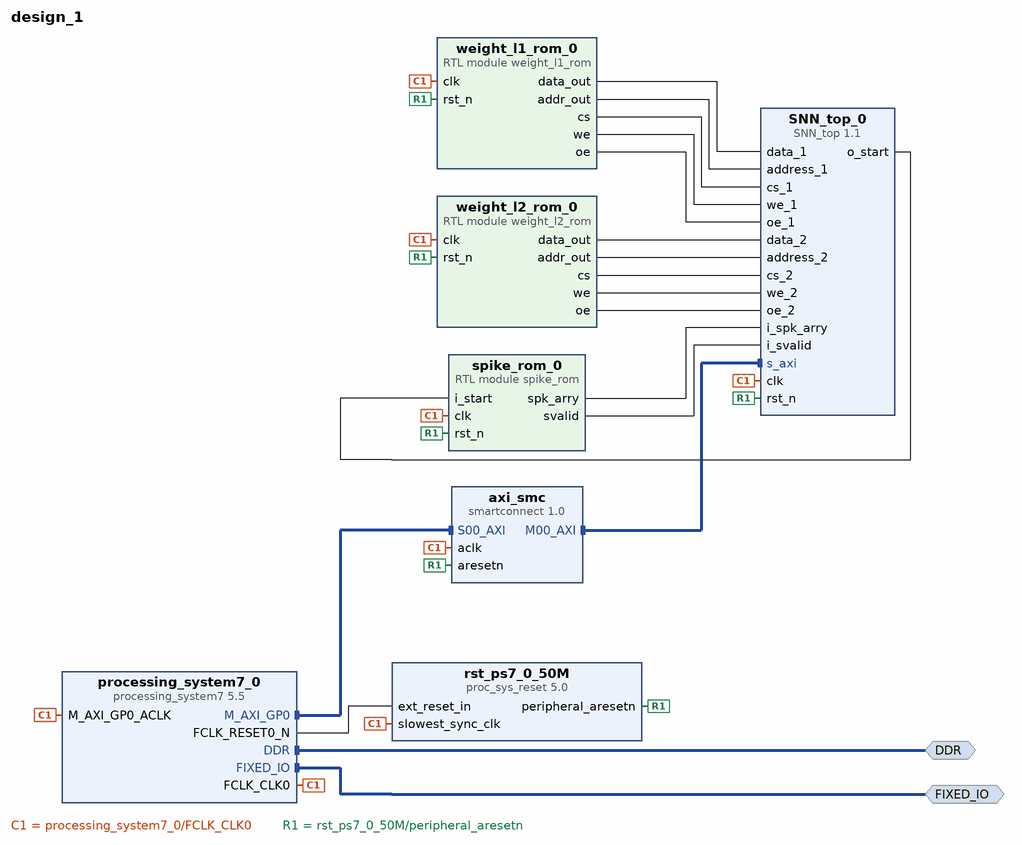
[diagram p0: block diagram of the top level]
# Vivado block design design_1, xc7z020clg484-1, Vivado 2017.1
create_bd_design design_1

create_bd_intf_port -mode Master -vlnv xilinx.com:interface:ddrx_rtl:1.0 DDR
create_bd_intf_port -mode Master -vlnv xilinx.com:display_processing_system7:fixedio_rtl:1.0 FIXED_IO

create_bd_cell -type ip -vlnv xilinx.com:ip:processing_system7:5.5 processing_system7_0
set_property -dict [list \
  CONFIG.PCW_FPGA0_PERIPHERAL_FREQMHZ 50 \
  CONFIG.PCW_UART1_PERIPHERAL_ENABLE 1 \
] [get_bd_cells processing_system7_0]
# 2 more settings of processing_system7_0 are not shown: defaults, MIO pin electricals, DDR timing, and values the tool derives
create_bd_cell -type ip -vlnv xilinx.com:ip:smartconnect:1.0 axi_smc
set_property -dict {CONFIG.NUM_SI 1} [get_bd_cells axi_smc]
create_bd_cell -type ip -vlnv xilinx.com:ip:proc_sys_reset:5.0 rst_ps7_0_50M
create_bd_cell -type module -reference weight_l1_rom weight_l1_rom_0
create_bd_cell -type module -reference weight_l2_rom weight_l2_rom_0
create_bd_cell -type module -reference spike_rom spike_rom_0
create_bd_cell -type ip -vlnv SNN:processor:SNN_top:1.1 SNN_top_0

# ---- connections ----

connect_bd_intf_net [get_bd_intf_pins processing_system7_0/M_AXI_GP0] [get_bd_intf_pins axi_smc/S00_AXI]
connect_bd_intf_net [get_bd_intf_pins axi_smc/M00_AXI] [get_bd_intf_pins SNN_top_0/s_axi]
connect_bd_intf_net [get_bd_intf_ports DDR] [get_bd_intf_pins processing_system7_0/DDR]
connect_bd_intf_net [get_bd_intf_ports FIXED_IO] [get_bd_intf_pins processing_system7_0/FIXED_IO]
connect_bd_net [get_bd_pins processing_system7_0/FCLK_CLK0] \
  [get_bd_pins processing_system7_0/M_AXI_GP0_ACLK] [get_bd_pins axi_smc/aclk] [get_bd_pins rst_ps7_0_50M/slowest_sync_clk] \
  [get_bd_pins weight_l1_rom_0/clk] [get_bd_pins weight_l2_rom_0/clk] [get_bd_pins spike_rom_0/clk] \
  [get_bd_pins SNN_top_0/clk]
connect_bd_net [get_bd_pins processing_system7_0/FCLK_RESET0_N] [get_bd_pins rst_ps7_0_50M/ext_reset_in]
connect_bd_net [get_bd_pins rst_ps7_0_50M/peripheral_aresetn] \
  [get_bd_pins axi_smc/aresetn] [get_bd_pins weight_l1_rom_0/rst_n] [get_bd_pins weight_l2_rom_0/rst_n] \
  [get_bd_pins spike_rom_0/rst_n] [get_bd_pins SNN_top_0/rst_n]
connect_bd_net [get_bd_pins weight_l1_rom_0/data_out] [get_bd_pins SNN_top_0/data_1]
connect_bd_net [get_bd_pins weight_l1_rom_0/addr_out] [get_bd_pins SNN_top_0/address_1]
connect_bd_net [get_bd_pins weight_l1_rom_0/cs] [get_bd_pins SNN_top_0/cs_1]
connect_bd_net [get_bd_pins weight_l1_rom_0/we] [get_bd_pins SNN_top_0/we_1]
connect_bd_net [get_bd_pins weight_l1_rom_0/oe] [get_bd_pins SNN_top_0/oe_1]
connect_bd_net [get_bd_pins weight_l2_rom_0/data_out] [get_bd_pins SNN_top_0/data_2]
connect_bd_net [get_bd_pins weight_l2_rom_0/addr_out] [get_bd_pins SNN_top_0/address_2]
connect_bd_net [get_bd_pins weight_l2_rom_0/cs] [get_bd_pins SNN_top_0/cs_2]
connect_bd_net [get_bd_pins weight_l2_rom_0/we] [get_bd_pins SNN_top_0/we_2]
connect_bd_net [get_bd_pins weight_l2_rom_0/oe] [get_bd_pins SNN_top_0/oe_2]
connect_bd_net [get_bd_pins spike_rom_0/spk_arry] [get_bd_pins SNN_top_0/i_spk_arry]
connect_bd_net [get_bd_pins spike_rom_0/svalid] [get_bd_pins SNN_top_0/i_svalid]
connect_bd_net [get_bd_pins SNN_top_0/o_start] [get_bd_pins spike_rom_0/i_start]

# ---- address map ----
assign_bd_address -offset 0x40000000 -range 1G -target_address_space [get_bd_addr_spaces processing_system7_0/Data] [get_bd_addr_segs SNN_top_0/s_axi/reg0]

validate_bd_design
save_bd_design
